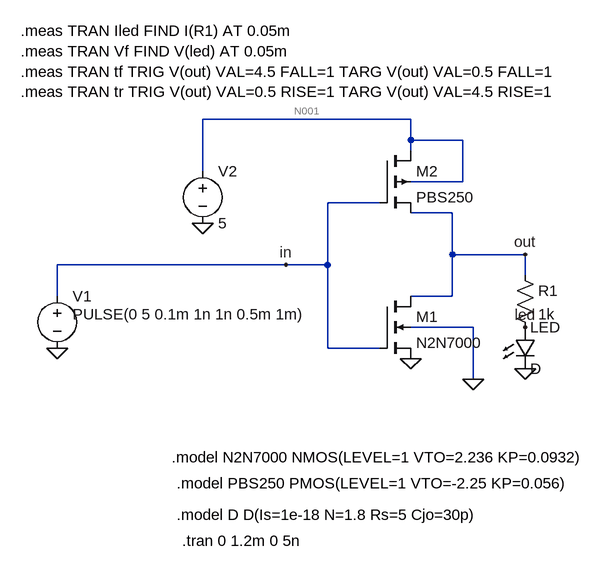
[diagram p0: schematic LTS.asc]
LTS.asc, the LTspice schematic file:
Version 4
SHEET 1 880 680
WIRE 240 -80 -80 -80
WIRE 240 -48 240 -80
WIRE 320 -48 240 -48
WIRE 240 -32 240 -48
WIRE -80 0 -80 -80
WIRE 320 16 320 -48
WIRE 320 16 240 16
WIRE 192 48 112 48
WIRE 304 64 240 64
WIRE 304 128 304 64
WIRE 416 128 304 128
WIRE 48 144 -304 144
WIRE 112 144 112 48
WIRE 112 144 48 144
WIRE 416 160 416 128
WIRE -304 192 -304 144
WIRE 304 192 304 128
WIRE 304 192 240 192
WIRE 336 240 240 240
WIRE 112 272 112 144
WIRE 192 272 112 272
WIRE 336 320 336 240
FLAG 416 304 0
FLAG 240 288 0
FLAG -80 80 0
FLAG 336 320 0
FLAG 416 128 out
FLAG 48 144 in
FLAG -304 272 0
FLAG 416 240 led
SYMBOL nmos4 192 192 R0
SYMATTR InstName M1
SYMATTR Value N2N7000
SYMBOL pmos4 192 -32 R0
SYMATTR InstName M2
SYMATTR Value PBS250
SYMBOL voltage -304 176 R0
WINDOW 123 0 0 Left 0
WINDOW 39 0 0 Left 0
WINDOW 3 24 44 Left 2
SYMATTR Value PULSE(0 5 0.1m 1n 1n 0.5m 1m)
SYMATTR InstName V1
SYMBOL res 400 144 R0
SYMATTR InstName R1
SYMATTR Value 1k
SYMBOL LED 400 240 R0
SYMATTR InstName LED
SYMBOL voltage -80 -16 R0
WINDOW 123 0 0 Left 0
WINDOW 39 0 0 Left 0
SYMATTR InstName V2
SYMATTR Value 5
TEXT -128 440 Left 2 !.model N2N7000 NMOS(LEVEL=1 VTO=2.236 KP=0.0932)
TEXT -120 480 Left 2 !.model PBS250 PMOS(LEVEL=1 VTO=-2.25 KP=0.056)
TEXT -120 528 Left 2 !.model D D(Is=1e-18 N=1.8 Rs=5 Cjo=30p)
TEXT -112 568 Left 2 !.tran 0 1.2m 0 5n
TEXT -360 -216 Left 2 !.meas TRAN Iled FIND I(R1) AT 0.05m\n.meas TRAN Vf FIND V(led) AT 0.05m\n.meas TRAN tf TRIG V(out) VAL=4.5 FALL=1 TARG V(out) VAL=0.5 FALL=1\n.meas TRAN tr TRIG V(out) VAL=0.5 RISE=1 TARG V(out) VAL=4.5 RISE=1

The netlist it stands for:
* LTS.asc
M1 out in 0 0 N2N7000
M2 N001 in out N001 PBS250
V1 in 0 PULSE(0 5 0.1m 1n 1n 0.5m 1m)
R1 out led 1k
D§LED led 0 D
V2 N001 0 5
.model D D
.lib standard.dio
.model NMOS NMOS
.model PMOS PMOS
.lib standard.mos
.model N2N7000 NMOS(LEVEL=1 VTO=2.236 KP=0.0932)
.model PBS250 PMOS(LEVEL=1 VTO=-2.25 KP=0.056)
.model D D(Is=1e-18 N=1.8 Rs=5 Cjo=30p)
.tran 0 1.2m 0 5n
.meas TRAN Iled FIND I(R1) AT 0.05m
.meas TRAN Vf FIND V(led) AT 0.05m
.meas TRAN tf TRIG V(out) VAL=4.5 FALL=1 TARG V(out) VAL=0.5 FALL=1
.meas TRAN tr TRIG V(out) VAL=0.5 RISE=1 TARG V(out) VAL=4.5 RISE=1
.backanno
.end

* Results of the author's LTspice run, read from the files saved beside the schematic
* Operating Point, zero values left out:
*   V(out) = 4.978 V
*   V(n001) = 5 V
*   V(led) = 1.68 V
*   Id(M2) = 3.298 mA
*   Is(M2) = -3.298 mA
*   Id(M1) = 9.967 pA
*   Ib(M1) = -4.988 pA
*   Is(M1) = -4.978 pA
*   I(Led) = 3.298 mA
*   I(R1) = 3.298 mA
*   I(V2) = -3.298 mA
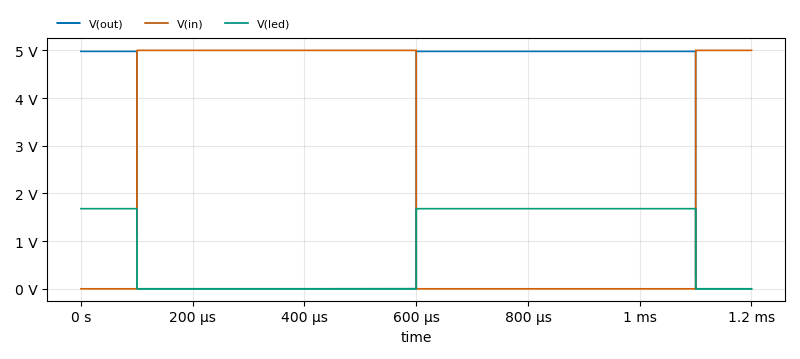
[diagram p1: Transient Analysis of LTS.asc, plotted from the saved traces]
* Transient Analysis, 1 run:
*   V(out): min 0 V, max 4.978 V, average 2.489 V, rms 3.52 V, last 0 V
*   V(in): min 0 V, max 5 V, average 2.5 V, rms 3.536 V, last 5 V
*   V(led): min -200.2 nV, max 1.68 V, average 840.2 mV, rms 1.188 V, last 0 V
* From the log:
*   iled: i(r1)=0.00329842 at 5e-005
*   vf: v(led)=1.68007 at 5e-005
*   tf=6.66554e-010 FROM 0.0001 TO 0.000100001
*   tr=3.01412e-011 FROM 0.000600002 TO 0.000600002